# Altium schematic sheet Current_Sense_Sheet.SchDoc
size A4
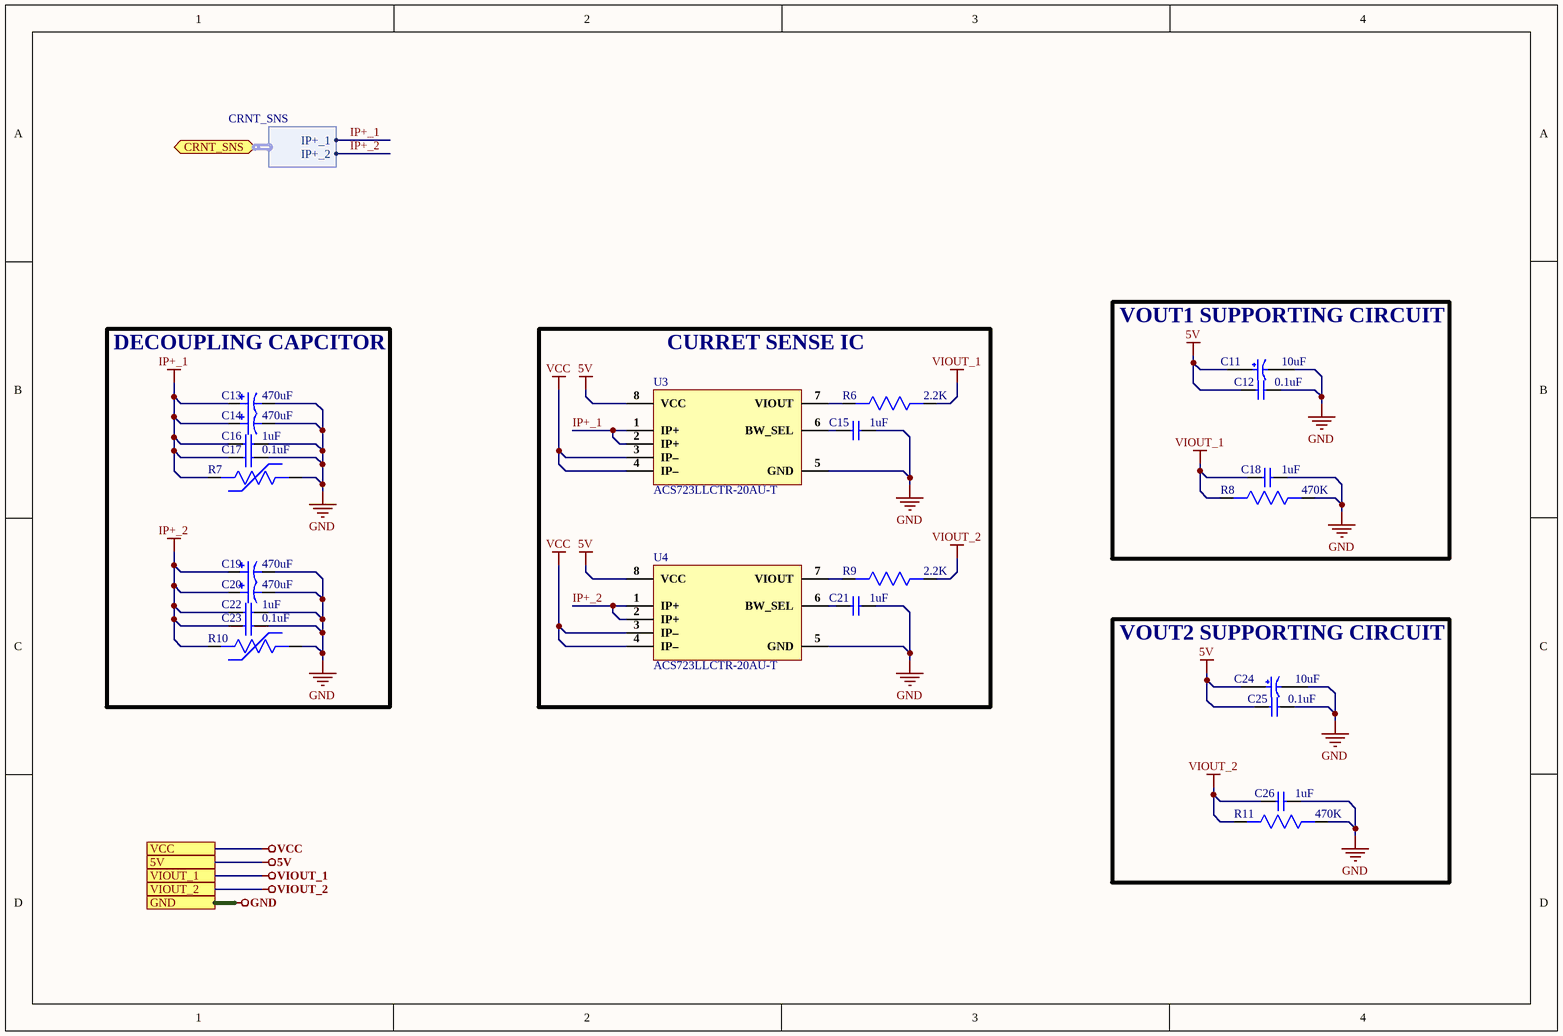
[diagram p0: Current_Sense_Sheet.SchDoc]

## Parts
C11  10uF  [RVT1E100M0405.]
C12  0.1uF  [Cap0603]
C13  470uF  [VT1H471MI135000CE0]
C14  470uF  [VT1H471MI135000CE0]
C15  1uF  [Cap0603]
C16  1uF  [Cap0603]
C17  0.1uF  [Cap0603]
C18  1uF  [Cap0603]
C19  470uF  [VT1H471MI135000CE0]
C20  470uF  [VT1H471MI135000CE0]
C21  1uF  [Cap0603]
C22  1uF  [Cap0603]
C23  0.1uF  [Cap0603]
C24  10uF  [RVT1E100M0405.]
C25  0.1uF  [Cap0603]
C26  1uF  [Cap0603]
R6  2.2K  [RES-0603]
R7  MOV-07D220K  [MOV-07D220K]  (value not drawn)
R8  470K  [RES-0603]
R9  2.2K  [RES-0603]
R10  MOV-07D220K  [MOV-07D220K]  (value not drawn)
R11  470K  [RES-0603]
U3  ACS723LLCTR-20AU-T  [SOIC-8]
U4  ACS723LLCTR-20AU-T  [SOIC-8]

## Blocks framed on the sheet
VOUT1 SUPPORTING CIRCUIT: C11 C12 C18 R8
DECOUPLING CAPCITOR: C13 C14 C16 C17 C19 C20 C22 C23 R7 R10
CURRET SENSE IC: C15 C21 R6 R9 U3 U4
VOUT2 SUPPORTING CIRCUIT: C24-C26 R11

## Ports
5V, CRNT_SNS (bidir, harness CRNT_SNS), GND, VCC, VIOUT_1, VIOUT_2

## Harnesses
CRNT_SNS: IP+_1, IP+_2

## Nets
5V: C11.1 C12.1 C24.1 C25.1 U3.8(VCC) U4.8(VCC) ; port 5V
GND: C11.2 C12.2 C13.2 C14.2 C15.2 C16.2 C17.2 C18.2 C19.2 C20.2 C21.2 C22.2 C23.2 C24.2 C25.2 C26.2 R7.1 R8.1 R10.1 R11.1 U3.5(GND) U4.5(GND) ; port GND
IP+_1: C13.1 C14.1 C16.1 C17.1 R7.2 U3.1(IP+) U3.2(IP+) ; port CRNT_SNS.IP+_1
IP+_2: C19.1 C20.1 C22.1 C23.1 R10.2 U4.1(IP+) U4.2(IP+) ; port CRNT_SNS.IP+_2
VCC: U3.3(IP–) U3.4(IP–) U4.3(IP–) U4.4(IP–) ; port VCC
VIOUT_1: C18.1 R6.1 R8.2 ; port VIOUT_1
VIOUT_2: C26.1 R9.1 R11.2 ; port VIOUT_2
NetC15_1: C15.1 U3.6(BW_SEL)
NetC21_1: C21.1 U4.6(BW_SEL)
NetR6_2: R6.2 U3.7(VIOUT)
NetR9_2: R9.2 U4.7(VIOUT)

## Library data of the parts
C11 C24 = RVT1E100M0405: CAP ALUM 10uF 25V SMD; Manufacturer: ROQANG; φD: 4mm; L: 5.4mm; Tolerance: ±20%; Operating Temperature: -45℃~+105℃; Rated Voltage: 25V; Capacitance: 10uF
C12 C17 C23 C25 = CC0603ZRY5V9BB104: CAP CER 0.1UF 50V Y5V 0603; Manufacturer: Yageo; Capacitance: 100nF; Tolerance: 80%; Supplier 1: Digi-Key; Manufacturer Part Number: CC0603ZRY5V9BB104; Stock 1: 15000880; Pricing 1: 1=0.1, 10=0.075, 100=0.0334, 500=0.02386, 1000=0.01874 (USD); Mount: Surface Mount; Case/Package: 0603; Number of Pins: 2; Case Code (Metric): 1608; Case Code (Imperial): 0603; Min Operating Temperature: -30°C; Max Operating Temperature: 85°C; Dielectric: Y5V; Voltage Rating: 50V; Package Quantity: 1; Packaging: Tape and Reel; Voltage Rating (DC): 50V; Termination: SMD/SMT; Composition: Ceramic; Voltage: 50V; Length: 1.6mm; Height: 0.8mm; Width: 0.031inch; Thickness: 0.035inch; Depth: 0.8mm; Radiation Hardening: No; REACH SVHC: No SVHC; Lead Free: Lead Free; Halogen Free: Halogen Free; ComponentLink1URL: http://www.yageo.com/documents/recent/UPY-GPHC_Y5V_6.3V-to-50V_8.pdf?src-supplier=Digi-Key; ComponentLink1Description: http://www.yageo.com/documents/recent/UPY-GPHC_Y5V_6.3V-to-50V_8.pdf?src-supplier=Digi-Key; ComponentLink2URL: http://www.yageo.com/documents/recent/UPY-GPHC_Y5V_6.3V-to-50V_5.pdf?src-supplier=Avnet+Europe; ComponentLink2Description: http://www.yageo.com/documents/recent/UPY-GPHC_Y5V_6.3V-to-50V_5.pdf?src-supplier=Avnet+Europe; ComponentLink3URL: https://www.verical.com/server-webapp/html/getDatasheet?partID=403611&src-supplier=Verical; ComponentLink3Description: https://www.verical.com/server-webapp/html/getDatasheet?partID=403611&src-supplier=Verical; ComponentLink4URL: http://www.mouser.com/ds/2/447/Yageo_UPY-GP_NP0_16V-to-50V_9-358835.pdf?src-supplier=Mouser; ComponentLink4Description: http://www.mouser.com/ds/2/447/Yageo_UPY-GP_NP0_16V-to-50V_9-358835.pdf?src-supplier=Mouser; ComponentLink5URL: http://www.farnell.com/datasheets/1132289.pdf?src-supplier=Element14; ComponentLink5Description: http://www.farnell.com/datasheets/1132289.pdf?src-supplier=Element14; Supplier Part Number 1: 311-1343-1-ND
C13 C14 C19 C20 = VT1H471MI135000CE0: 470uF ±20% 50V 12.5mm 13.5mm 1000hrs 105℃ -40℃~+105℃ SMD,12.5x13.5mm Aluminum Electrolytic Capacitors - SMD RoHS; Manufacturer: Changzhou Huawei Elec; Package: SMD,12.5x13.5mm; Capacitance: 470uF; Tolerance: ±20%; Rated Voltage: 50V; φD: 12.5mm; L: 13.5mm; Lifetime @ Temp: 1000hrs 105℃; Operating Temperature: -40℃~+105℃
C15 C16 C18 C21 C22 C26 = CC0603KRX5R8BB105: CAP CER 1UF 25V X5R 0603; Manufacturer: Yageo; Tolerance: 10%; Supplier 1: Digi-Key; Manufacturer Part Number: CC0603KRX5R8BB105; Stock 1: 1419041; Pricing 1: 1=0.1, 10=0.069, 100=0.0307, 500=0.0219, 1000=0.0172 (USD); Mount: Surface Mount; Case/Package: 0603; Number of Pins: 2; Case Code (Metric): 1608; Case Code (Imperial): 0603; Min Operating Temperature: -55°C; Max Operating Temperature: 85°C; Capacitance: 1uF; Dielectric: X5R; Package Quantity: 1; Voltage Rating: 25V; Packaging: Tape and Reel; Termination: SMD/SMT; Voltage Rating (DC): 25V; Length: 1.6mm; Height: 0.8mm; Width: 0.031inch; Thickness: 0.035inch; Depth: 0.8mm; Radiation Hardening: No; REACH SVHC: No SVHC; Lead Free: Lead Free; Halogen Free: Halogen Free; ComponentLink1URL: http://www.yageo.com/documents/recent/UPY-GPHC_X5R_4V-to-50V_25.pdf?src-supplier=Digi-Key; ComponentLink1Description: http://www.yageo.com/documents/recent/UPY-GPHC_X5R_4V-to-50V_25.pdf?src-supplier=Digi-Key; ComponentLink2URL: http://www.yageo.com/documents/recent/UPY-GPHC_X5R_4V-to-50V_12.pdf?src-supplier=Avnet+Europe; ComponentLink2Description: http://www.yageo.com/documents/recent/UPY-GPHC_X5R_4V-to-50V_12.pdf?src-supplier=Avnet+Europe; ComponentLink3URL: http://www.farnell.com/datasheets/1525783.pdf?src-supplier=Element14; ComponentLink3Description: http://www.farnell.com/datasheets/1525783.pdf?src-supplier=Element14; ComponentLink4URL: http://www.yageo.com/documents/recent/UPY-GPHC_X5R_4V-to-50V_12.pdf?src-supplier=Avnet; ComponentLink4Description: http://www.yageo.com/documents/recent/UPY-GPHC_X5R_4V-to-50V_12.pdf?src-supplier=Avnet; Supplier Part Number 1: 311-1445-6-ND
R6 R9 = RC0603FR-072K2L: RES SMD 2.2K OHM 1% 1/10W 0603; Manufacturer: Yageo Phycomp; Temperature Coefficient: 100ppm/°C; Resistance: 2.2kR; Power Rating: 100mW; Voltage Rating (DC): 50V; Supplier 1: Digi-Key; Manufacturer Part Number: RC0603FR-072K2L; Stock 1: 10587920; Pricing 1: 1=0.1, 10=0.023, 100=0.0094, 1000=0.00421, 2500=0.00366 (USD); Mount: Surface Mount; Case/Package: 0603; Number of Pins: 2; Min Operating Temperature: -55°C; Max Operating Temperature: 155°C; Tolerance: 1%; Packaging: Cut Tape; Length: 1.6mm; Height: 0.45mm; Width: 800um; Depth: 0.8mm; REACH SVHC: No SVHC; Lead Free: Lead Free; Supplier Part Number 1: 311-2.20KHRCT-ND
R7 R10 = MOV-07D220K: VARISTOR 22V 250A DISC 7MM; Manufacturer: Bourns; Capacitance: 2.3nF; Voltage Rating (DC): 24V; Tolerance: 10%; Max Voltage Rating (AC): 14V; Max Voltage Rating (DC): 18V; Number of Circuits: 1; Energy: 1.1J; Clamping Voltage: 43V; Clamping Current: 2.5A; Min Varistor Voltage: 20V; Lead/Base Style: Radial; Supplier 1: Digi-Key; Manufacturer Part Number: MOV-07D220K; RoHS: Yes; Category: Varistors; Stock 1: 292; Pricing 1: 1=0.43000, 10=0.30800, 25=0.23920, 100=0.18130, 250=0.12824, 500=0.10260, 1000=0.07866, 2500=0.06840, 5000=0.06156 (USD); Mount: Through Hole,Radial; Case/Package: Radial; Min Operating Temperature: -40°C; Max Operating Temperature: 85°C; Packaging: Bulk; Max Surge Current: 250A; Package Quantity: 2000; Varistor Voltage: 22V; Max Varistor Voltage: 24V; Series: -; Diameter: 7mm; Width: 6.8mm; Lead Pitch: 5mm; Radiation Hardening: No; RoHS Compliant: Yes; ComponentLink1URL: https://datasheet.ciiva.com/30093/mov07d-30093751.pdf?src-supplier=Onlinecomponents.com; ComponentLink1Description: https://datasheet.ciiva.com/30093/mov07d-30093751.pdf?src-supplier=Onlinecomponents.com; ComponentLink2URL: https://datasheet.ciiva.com/369/mov07d-369225.pdf?src-supplier=Digi-Key; ComponentLink2Description: https://datasheet.ciiva.com/369/mov07d-369225.pdf?src-supplier=Digi-Key; ComponentLink3URL: https://datasheet.ciiva.com/3026/mov07d-3026223.pdf?src-supplier=Avnet; ComponentLink3Description: https://datasheet.ciiva.com/3026/mov07d-3026223.pdf?src-supplier=Avnet; Supplier Part Number 1: MOV-07D220K-ND
R8 R11 = AC0603JR-07470KL: RES SMD 470K OHM 5% 1/10W 0603; Manufacturer: Yageo; Resistance: 470kR; Power Rating: 100mW; Voltage Rating: 50V; Temperature Coefficient: 100ppm/°C; ComponentLink1URL: https://datasheet.ciiva.com/11820/0900766b80808d64-11820639.pdf?src-supplier=RSComponents; ComponentLink1Description: https://datasheet.ciiva.com/11820/0900766b80808d64-11820639.pdf?src-supplier=RSComponents; ComponentLink2URL: https://datasheet.ciiva.com/2487/rr-data-sheet-2487286.pdf?src-supplier=Digi-Key; ComponentLink2Description: https://datasheet.ciiva.com/2487/rr-data-sheet-2487286.pdf?src-supplier=Digi-Key; ComponentLink3URL: https://datasheet.ciiva.com/7984/87330-7984374.pdf?src-supplier=Element14; ComponentLink3Description: https://datasheet.ciiva.com/7984/87330-7984374.pdf?src-supplier=Element14; ComponentLink4URL: https://datasheet.ciiva.com/2487/rr-data-sheet-2487287.pdf?src-supplier=Digi-Key; ComponentLink4Description: https://datasheet.ciiva.com/2487/rr-data-sheet-2487287.pdf?src-supplier=Digi-Key; ComponentLink5URL: https://datasheet.ciiva.com/2487/rr-data-sheet-2487288.pdf?src-supplier=Digi-Key; ComponentLink5Description: https://datasheet.ciiva.com/2487/rr-data-sheet-2487288.pdf?src-supplier=Digi-Key; ComponentLink6URL: https://datasheet.ciiva.com/5759/87330-5759049.pdf?src-supplier=Farnell; ComponentLink6Description: https://datasheet.ciiva.com/5759/87330-5759049.pdf?src-supplier=Farnell; Supplier 1: Digi-Key; Manufacturer Part Number: AC0603JR-07470KL; Stock 1: 71; Pricing 1: 1=0.1, 10=0.024, 100=0.0097, 1000=0.0044, 2500=0.0038 (USD); Case/Package: 0603; Case Code (Imperial): 0603; Case Code (Metric): 1608; Weight: 7.1E-05oz; Min Operating Temperature: -55°C; Max Operating Temperature: 155°C; Tolerance: 5%; Packaging: Tape and Reel; Resistor Type: Thick Film; Termination: SMD/SMT; Number of Terminations: 2; Max Power Dissipation: 100mW; Features: Moisture Resistant,Automotive AEC-Q200; Series: AC; Length: 0.063inch; Width: 0.8mm; Height: 0.022inch; RoHS Compliant: Yes; ComponentLink7URL: http://www.mouser.com/ds/2/447/yageodocoutput-1111992.pdf?src-supplier=Mouser; ComponentLink7Description: http://www.mouser.com/ds/2/447/yageodocoutput-1111992.pdf?src-supplier=Mouser; Supplier Part Number 1: YAG3672DKR-ND
U3 U4 = ACS723LLCTR-20AU-T: SENSOR CURRENT HALL 20A DC; Manufacturer: Allegro MicroSystems; Number of Channels: 1; Frequency: 80kHz; Response Time: 5us; Max Supply Current: 14mA; Polarity: Unidirectional; Linearity: 1%; Accuracy: 3%; Sensitivity: 200mV/A; Supplier 1: Digi-Key; Manufacturer Part Number: ACS723LLCTR-20AU-T; RoHS: Yes; Category: Current Sensors; Pricing 1: 1=4.46000, 5=3.94000, 10=3.47900, 25=2.82280, 50=2.49480, 100=2.42900, 500=2.03516, 1000=1.90385 (USD); Mount: Surface Mount; Case/Package: SOIC; Number of Pins: 8; Min Operating Temperature: -40°C; Max Operating Temperature: 150°C; Packaging: Tape and Reel; Current Sensing: 20A; RoHS Compliant: Yes; ComponentLink1URL: http://www.farnell.com/datasheets/2838158.pdf?src-supplier=Farnell; ComponentLink1Description: http://www.farnell.com/datasheets/2838158.pdf?src-supplier=Farnell; ComponentLink2URL: http://www.farnell.com/datasheets/2838158.pdf?src-supplier=Newark; ComponentLink2Description: http://www.farnell.com/datasheets/2838158.pdf?src-supplier=Newark; ComponentLink3URL: http://www.allegromicro.com/~/media/Files/Datasheets/ACS723-Datasheet.ashx?src-supplier=Digi-Key; ComponentLink3Description: http://www.allegromicro.com/~/media/Files/Datasheets/ACS723-Datasheet.ashx?src-supplier=Digi-Key; ComponentLink4URL: https://www.allegromicro.com/~/media/Files/Datasheets/ACS723-Datasheet.ashx?src-supplier=Digi-Key; ComponentLink4Description: https://www.allegromicro.com/~/media/Files/Datasheets/ACS723-Datasheet.ashx?src-supplier=Digi-Key; Supplier Part Number 1: 620-1645-1-ND